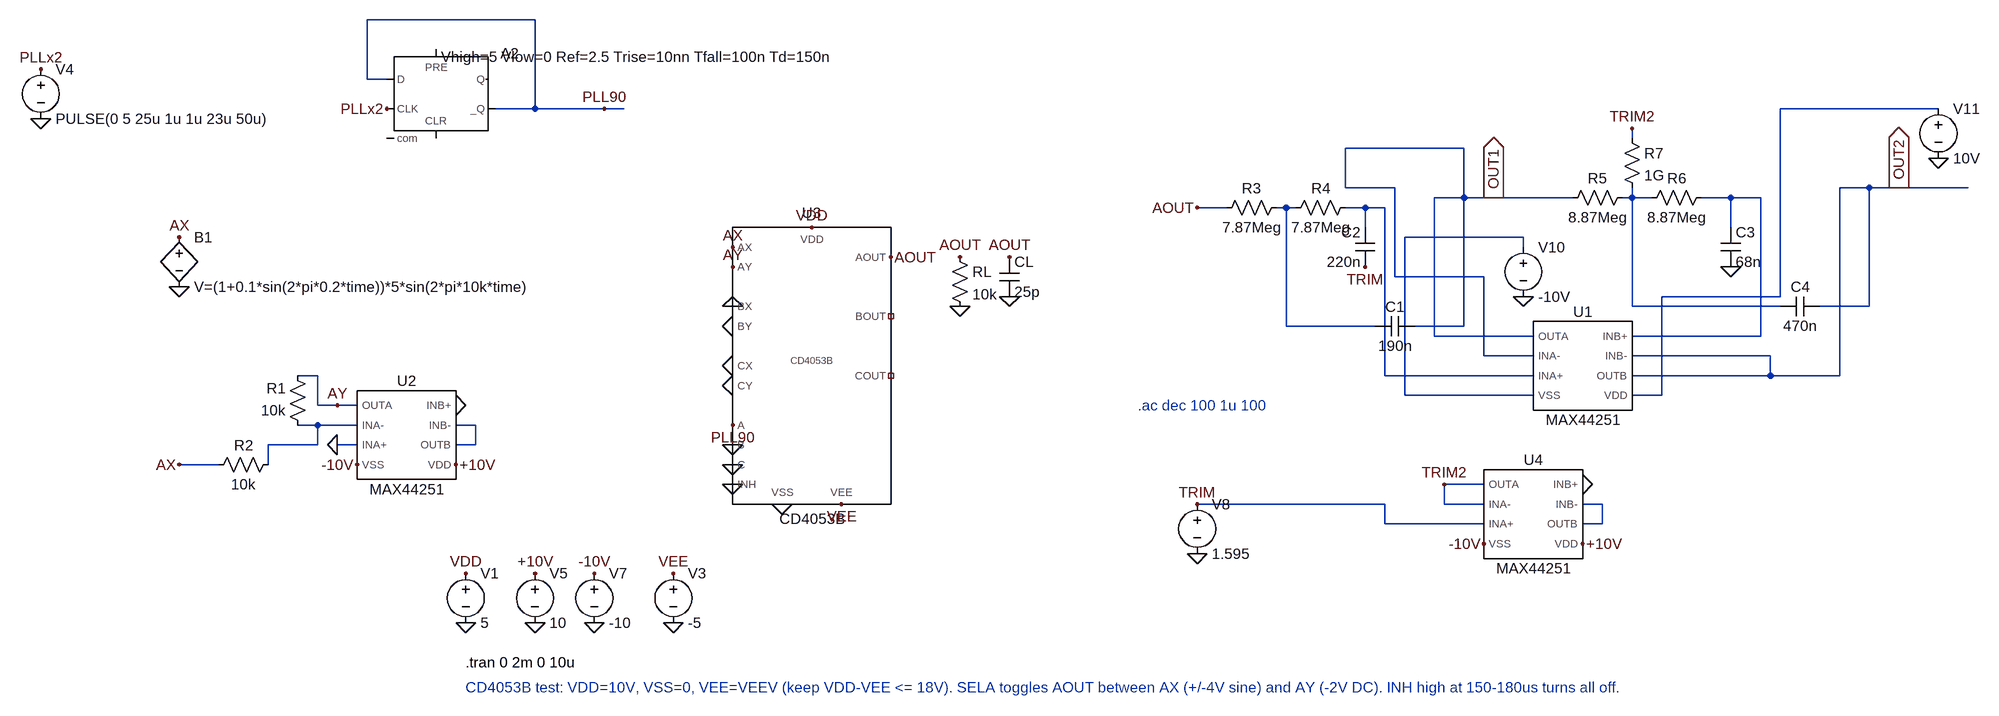
[diagram p0: schematic CD4053B_bipolar_test.asc]
CD4053B_bipolar_test.asc, the LTspice schematic file:
Version 4.1
SHEET 1 2536 900
WIRE 192 -240 -80 -240
WIRE -80 -144 -80 -240
WIRE -48 -144 -80 -144
WIRE 192 -96 192 -240
WIRE 192 -96 128 -96
WIRE 304 -96 192 -96
WIRE 336 -96 304 -96
WIRE 2464 -96 2208 -96
WIRE 1968 -48 1968 -64
WIRE 1696 -32 1504 -32
WIRE 1504 32 1504 -32
WIRE 1584 32 1504 32
WIRE 2352 32 2304 32
WIRE 2400 32 2352 32
WIRE 2512 32 2400 32
WIRE 1696 48 1696 -32
WIRE 1696 48 1648 48
WIRE 1744 48 1696 48
WIRE 1872 48 1744 48
WIRE 1968 48 1968 32
WIRE 1968 48 1952 48
WIRE 2000 48 1968 48
WIRE 2128 48 2080 48
WIRE 2176 48 2128 48
WIRE 1312 64 1264 64
WIRE 1408 64 1392 64
WIRE 1424 64 1408 64
WIRE 1536 64 1504 64
WIRE 1568 64 1536 64
WIRE 1536 96 1536 64
WIRE 2128 96 2128 48
WIRE 1792 112 1600 112
WIRE 1792 128 1792 112
WIRE 1584 176 1584 32
WIRE 1728 176 1584 176
WIRE 2208 208 2208 -96
WIRE 2208 208 2016 208
WIRE 1968 224 1968 48
WIRE 2208 224 1968 224
WIRE 2352 224 2352 32
WIRE 2352 224 2272 224
WIRE 1408 256 1408 64
WIRE 1552 256 1408 256
WIRE 1696 256 1696 48
WIRE 1696 256 1616 256
WIRE 1648 272 1648 48
WIRE 1808 272 1648 272
WIRE 2176 272 2176 48
WIRE 2176 272 1968 272
WIRE 1728 304 1728 176
WIRE 1808 304 1728 304
WIRE 2192 304 1968 304
WIRE -160 336 -192 336
WIRE 1568 336 1568 64
WIRE 1808 336 1568 336
WIRE 2192 336 2192 304
WIRE 2192 336 1968 336
WIRE 2304 336 2304 32
WIRE 2304 336 2192 336
WIRE 1600 368 1600 112
WIRE 1808 368 1600 368
WIRE 2016 368 2016 208
WIRE 2016 368 1968 368
WIRE -160 384 -160 336
WIRE -128 384 -160 384
WIRE -96 384 -128 384
WIRE -160 416 -192 416
WIRE -96 416 -160 416
WIRE 96 416 64 416
WIRE -160 448 -160 416
WIRE -160 448 -240 448
WIRE -96 448 -128 448
WIRE 96 448 96 416
WIRE 96 448 64 448
WIRE -320 480 -384 480
WIRE -240 480 -240 448
WIRE 1728 512 1664 512
WIRE 1568 544 1264 544
WIRE 1664 544 1664 512
WIRE 1728 544 1664 544
WIRE 1920 544 1888 544
WIRE 1568 576 1568 544
WIRE 1728 576 1568 576
WIRE 1920 576 1920 544
WIRE 1920 576 1888 576
FLAG 512 128 AX
FLAG 512 160 AY
FLAG 512 224 0
FLAG 512 256 0
FLAG 512 320 0
FLAG 512 352 0
FLAG 512 448 0
FLAG 512 480 0
FLAG 768 144 AOUT
FLAG 640 96 VDD
FLAG 592 544 0
FLAG 80 656 VDD
FLAG 80 736 0
FLAG -608 -80 0
FLAG 880 144 AOUT
FLAG 880 224 0
FLAG 960 144 AOUT
FLAG 960 208 0
FLAG 512 512 0
FLAG -128 448 0
FLAG 192 656 +10V
FLAG 192 736 0
FLAG 288 656 -10V
FLAG 288 736 0
FLAG 64 480 +10V
FLAG -96 480 -10V
FLAG -384 480 AX
FLAG -128 384 AY
FLAG -48 -96 PLLx2
FLAG -608 -160 PLLx2
FLAG 304 -96 PLL90
FLAG 512 416 PLL90
FLAG 64 384 0
FLAG 1792 208 0
FLAG 1744 48 OUT1
IOPIN 1744 48 Out
FLAG 2128 160 0
FLAG 2464 -16 0
FLAG 2400 32 OUT2
IOPIN 2400 32 Out
FLAG 416 656 VEE
FLAG 416 736 0
FLAG 688 544 VEE
FLAG 1888 608 +10V
FLAG 1728 608 -10V
FLAG 1888 512 0
FLAG 1264 624 0
FLAG 1264 544 TRIM
FLAG 1664 512 TRIM2
FLAG 1536 160 TRIM
FLAG 1968 -64 TRIM2
FLAG 1264 64 AOUT
FLAG -384 112 AX
FLAG -384 192 0
SYMBOL voltage 80 640 R0
WINDOW 123 0 0 Left 0
WINDOW 39 0 0 Left 0
SYMATTR InstName V1
SYMATTR Value 5
SYMBOL voltage -608 -176 R0
WINDOW 123 0 0 Left 0
WINDOW 39 0 0 Left 0
SYMATTR InstName V4
SYMATTR Value PULSE(0 5 25u 1u 1u 23u 50u)
SYMBOL res 864 128 R0
SYMATTR InstName RL
SYMATTR Value 10k
SYMBOL cap 944 144 R0
SYMATTR InstName CL
SYMATTR Value 25p
SYMBOL MAX44251 -16 432 R0
SYMATTR InstName U2
SYMBOL res -176 432 R180
WINDOW 0 36 76 Left 2
WINDOW 3 36 40 Left 2
SYMATTR InstName R1
SYMATTR Value 10k
SYMBOL res -224 464 R90
WINDOW 0 0 56 VBottom 2
WINDOW 3 32 56 VTop 2
SYMATTR InstName R2
SYMATTR Value 10k
SYMBOL voltage 192 640 R0
WINDOW 123 0 0 Left 0
WINDOW 39 0 0 Left 0
SYMATTR InstName V5
SYMATTR Value 10
SYMBOL voltage 288 640 R0
WINDOW 123 0 0 Left 0
WINDOW 39 0 0 Left 0
SYMATTR InstName V7
SYMATTR Value -10
SYMBOL CD4053B_LTspice\\CD4053B 640 320 R0
SYMATTR InstName U3
SYMBOL Digital\\dflop 32 -192 R0
WINDOW 39 8 12 Left 2
SYMATTR SpiceLine Vhigh=5 Vlow=0 Ref=2.5 Trise=10nn Tfall=100n Td=150n
SYMATTR InstName A2
SYMBOL cap 1616 240 R90
WINDOW 0 0 32 VBottom 2
WINDOW 3 32 32 VTop 2
SYMATTR InstName C1
SYMATTR Value 190n
SYMBOL cap 1552 160 R180
WINDOW 0 24 56 Left 2
WINDOW 3 24 8 Left 2
SYMATTR InstName C2
SYMATTR Value 220n
SYMBOL res 1408 48 R90
WINDOW 0 0 56 VBottom 2
WINDOW 3 32 56 VTop 2
SYMATTR InstName R3
SYMATTR Value 7.87Meg
SYMBOL res 1520 48 R90
WINDOW 0 0 56 VBottom 2
WINDOW 3 32 56 VTop 2
SYMATTR InstName R4
SYMATTR Value 7.87Meg
SYMBOL voltage 1792 112 R0
WINDOW 123 0 0 Left 0
WINDOW 39 0 0 Left 0
SYMATTR InstName V10
SYMATTR Value -10V
SYMBOL res 1968 32 R90
WINDOW 0 0 56 VBottom 2
WINDOW 3 32 56 VTop 2
SYMATTR InstName R5
SYMATTR Value 8.87Meg
SYMBOL res 1984 64 R270
WINDOW 0 32 56 VTop 2
WINDOW 3 0 56 VBottom 2
SYMATTR InstName R6
SYMATTR Value 8.87Meg
SYMBOL cap 2112 96 R0
SYMATTR InstName C3
SYMATTR Value 68n
SYMBOL cap 2272 208 R90
WINDOW 0 0 32 VBottom 2
WINDOW 3 32 32 VTop 2
SYMATTR InstName C4
SYMATTR Value 470n
SYMBOL voltage 2464 -112 R0
WINDOW 123 0 0 Left 0
WINDOW 39 0 0 Left 0
SYMATTR InstName V11
SYMATTR Value 10V
SYMBOL MAX44251 1888 320 R0
SYMATTR InstName U1
SYMBOL voltage 416 640 R0
WINDOW 123 0 0 Left 0
WINDOW 39 0 0 Left 0
SYMATTR InstName V3
SYMATTR Value -5
SYMBOL MAX44251 1808 560 R0
SYMATTR InstName U4
SYMBOL voltage 1264 528 R0
WINDOW 123 0 0 Left 0
WINDOW 39 0 0 Left 0
SYMATTR InstName V8
SYMATTR Value 1.595
SYMBOL res 1952 -64 R0
SYMATTR InstName R7
SYMATTR Value 1G
SYMBOL bv -384 96 R0
SYMATTR InstName B1
SYMATTR Value V=(1+0.1*sin(2*pi*0.2*time))*5*sin(2*pi*10k*time)
TEXT 80 800 Left 2 !.tran 0 2m 0 10u
TEXT 80 840 Left 2 ;CD4053B test: VDD=10V, VSS=0, VEE=VEEV (keep VDD-VEE <= 18V). SELA toggles AOUT between AX (+/-4V sine) and AY (-2V DC). INH high at 150-180us turns all off.
TEXT 1168 384 Left 2 ;.ac dec 100 1u 100

The netlist it stands for:
* CD4053B_bipolar_test.asc
V1 VDD 0 5
V4 PLLx2 0 PULSE(0 5 25u 1u 1u 23u 50u)
RL AOUT 0 10k
CL AOUT 0 25p
X§U2 AY N007 0 -10V 0 N008 N008 +10V MAX44251  ; pins OUTA INA- INA+ VSS INB+ INB- OUTB VDD
R1 N007 AY 10k
R2 N007 AX 10k
V5 +10V 0 10
V7 -10V 0 -10
X§U3 0 0 0 NC_01 0 0 VEE 0 0 0 PLL90 AX AY AOUT NC_02 VDD CD4053B  ; pins BY BX CY COUT CX INH VEE VSS C B A AX AY AOUT BOUT VDD
A2 PLL90 0 PLLx2 0 0 PLL90 0 0 DFLOP Vhigh=5 Vlow=0 Ref=2.5 Trise=10nn Tfall=100n Td=150n
C1 OUT1 N004 190n
C2 TRIM N005 220n
R3 N004 AOUT 7.87Meg
R4 N005 N004 7.87Meg
V10 N006 0 -10V
R5 N002 OUT1 8.87Meg
R6 N002 N003 8.87Meg
C3 N003 0 68n
C4 OUT2 N002 470n
V11 N001 0 10V
X§U1 OUT1 OUT1 N005 N006 N003 OUT2 OUT2 N001 MAX44251  ; pins OUTA INA- INA+ VSS INB+ INB- OUTB VDD
V3 VEE 0 -5
X§U4 TRIM2 TRIM2 TRIM -10V 0 N009 N009 +10V MAX44251  ; pins OUTA INA- INA+ VSS INB+ INB- OUTB VDD
V8 TRIM 0 1.595
R7 TRIM2 N002 1G
B1 AX 0 V=(1+0.1*sin(2*pi*0.2*time))*5*sin(2*pi*10k*time)
.tran 0 2m 0 10u
* CD4053B test: VDD=10V, VSS=0, VEE=VEEV (keep VDD-VEE <= 18V). SELA toggles AOUT between AX (+/-4V sine) and AY (-2V DC). INH high at 150-180us turns all off.
* .ac dec 100 1u 100
.lib max44251.lib
.lib CD4053B.lib
.backanno
.end